# Altium project Main_Board.PrjPcb (part 17 of 44)
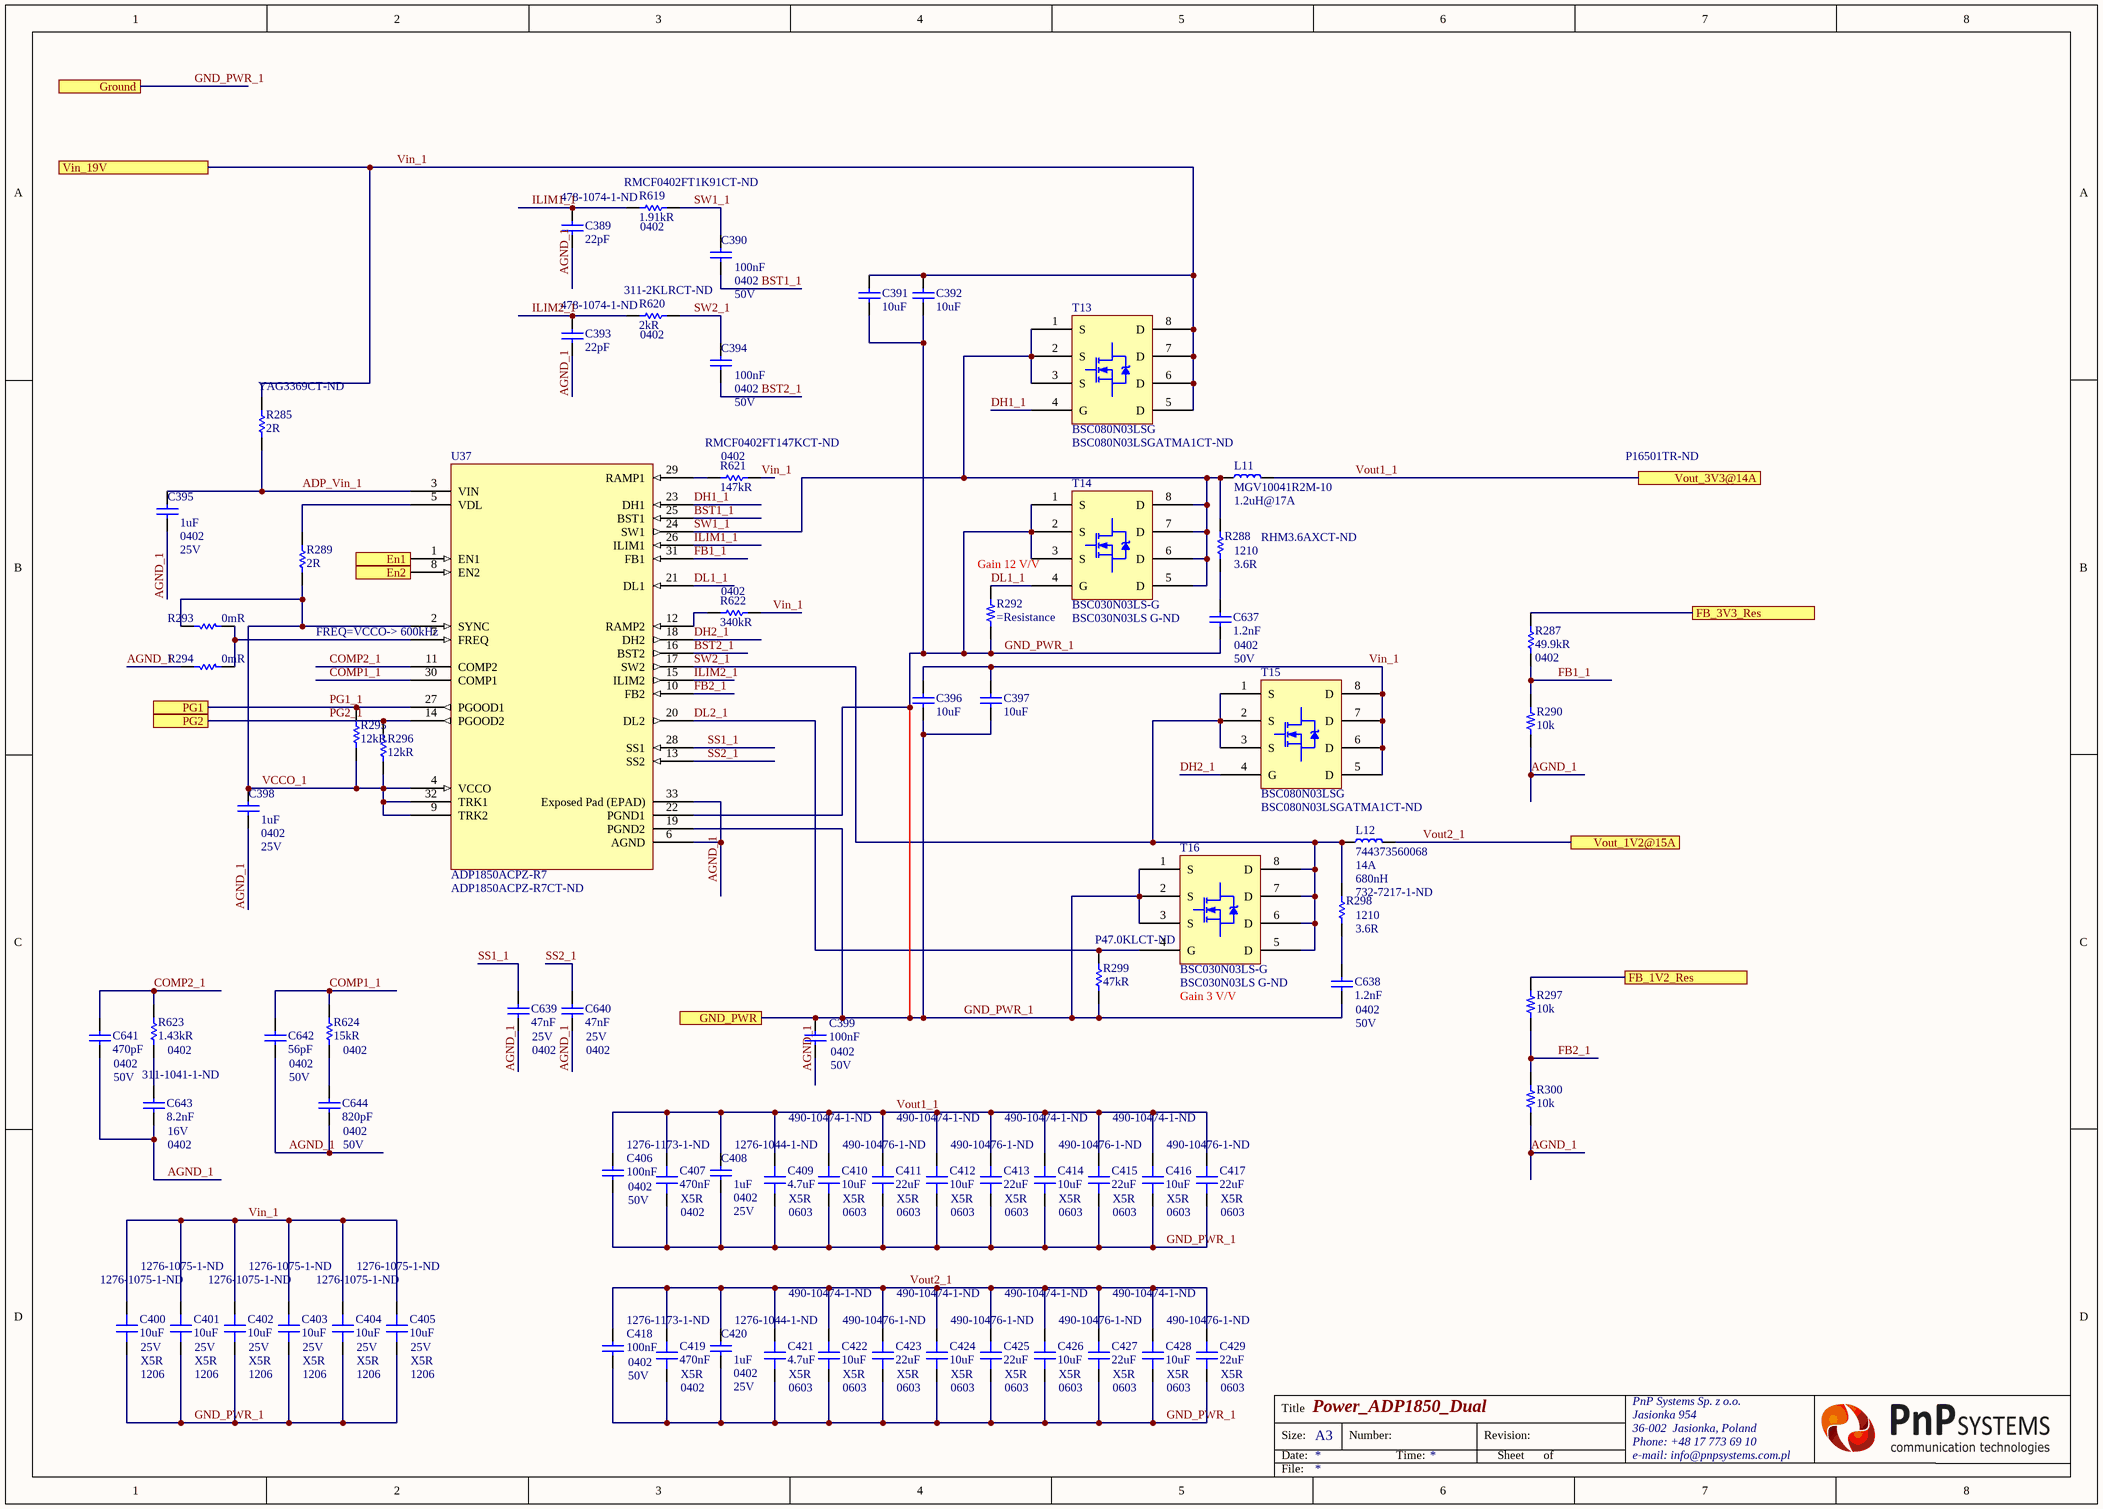
[diagram p128: Power_ADP1850_Dual.SchDoc]

## Sheet Power_ADP1850_Dual.SchDoc: Power_ADP1850_Dual (continued)
### Library data of the parts
C389 C393 = Capacitor: as C345 on sheet HI_Curr_ADP1850; Supplier 1: Digi-Key; Stock 1: 1489814; Pricing 1: 1 = 0,10000, 10 = 0,03500, 100 = 0,01550, 500 = 0,01108, 1000 = 0,00871, 2500 = 0,00792, 5000 = 0,00729 (USD); RoHS: Yes; Mount: Surface Mount; Case/Package: 0402; Number of Pins: 2; Case Code (Metric): 1005; Case Code (Imperial): 0402; Contact Plating: Tin,Matte; Min Operating Temperature: -55°C; Max Operating Temperature: 125°C; Capacitance: 22pF; Packaging: Tape and Reel; Voltage Rating (DC): 50V; Package Quantity: 1; Termination: SMD/SMT; Voltage: 50V; Length: 1mm; Height: 0.5mm; Width: 0.02inch; Depth: 0.5mm; Thickness: 0.022inch; Radiation Hardening: No; Lead Free: Lead Free; REACH SVHC: No SVHC; ComponentLink1URL: https://datasheet.ciiva.com/11787/0900766b80def0e2-11787300.pdf?src-supplier=RSComponents; ComponentLink1Description: https://datasheet.ciiva.com/11787/0900766b80def0e2-11787300.pdf?src-supplier=RSComponents; ComponentLink2URL: https://datasheet.ciiva.com/39121/2009578-39121644.pdf?src-supplier=Jameco; ComponentLink2Description: https://datasheet.ciiva.com/39121/2009578-39121644.pdf?src-supplier=Jameco; ComponentLink3URL: https://datasheet.ciiva.com/1123/ccog-1123585.pdf?src-supplier=Element14; ComponentLink3Description: https://datasheet.ciiva.com/1123/ccog-1123585.pdf?src-supplier=Element14; ComponentLink4URL: https://datasheet.ciiva.com/1123/ccog-1123586.pdf?src-supplier=Element14; ComponentLink4Description: https://datasheet.ciiva.com/1123/ccog-1123586.pdf?src-supplier=Element14; ComponentLink5URL: https://datasheet.ciiva.com/150/ccog-150515.pdf?src-supplier=Digi-Key; ComponentLink5Description: https://datasheet.ciiva.com/150/ccog-150515.pdf?src-supplier=Digi-Key; ComponentLink6URL: https://datasheet.ciiva.com/150/ccog-150516.pdf?src-supplier=Digi-Key; ComponentLink6Description: https://datasheet.ciiva.com/150/ccog-150516.pdf?src-supplier=Digi-Key; ComponentLink7URL: https://datasheet.ciiva.com/150/ccog-150517.pdf?src-supplier=Digi-Key; ComponentLink7Description: https://datasheet.ciiva.com/150/ccog-150517.pdf?src-supplier=Digi-Key; ComponentLink8URL: https://datasheet.ciiva.com/2987/ccog-2987653.pdf?src-supplier=Avnet; ComponentLink8Description: https://datasheet.ciiva.com/2987/ccog-2987653.pdf?src-supplier=Avnet; ComponentLink9URL: https://datasheet.ciiva.com/2987/ccog-2987654.pdf?src-supplier=Avnet; ComponentLink9Description: https://datasheet.ciiva.com/2987/ccog-2987654.pdf?src-supplier=Avnet; ComponentLink10URL: https://datasheet.ciiva.com/5423/ccog-243403-5423927.pdf?src-supplier=Mouser; ComponentLink10Description: https://datasheet.ciiva.com/5423/ccog-243403-5423927.pdf?src-supplier=Mouser; ComponentLink11URL: https://datasheet.ciiva.com/16218/ccog-16218185.pdf?src-supplier=Future+Electronics; ComponentLink11Description: https://datasheet.ciiva.com/16218/ccog-16218185.pdf?src-supplier=Future+Electronics; ComponentLink12URL: https://datasheet.ciiva.com/28592/759117-28592746.pdf?src-supplier=Element14; ComponentLink12Description: https://datasheet.ciiva.com/28592/759117-28592746.pdf?src-supplier=Element14; ComponentLink13URL: https://datasheet.ciiva.com/15165/getdatasheetpartid-38041-15165131.pdf?src-supplier=Verical; ComponentLink13Description: https://datasheet.ciiva.com/15165/getdatasheetpartid-38041-15165131.pdf?src-supplier=Verical
C390 C394 C399 C406 C418 = Capacitor: as C346 on sheet HI_Curr_ADP1850; Supplier 1: Digi-Key; Supplier Part Number 1: 490-10697-1-ND; RoHS: Yes; Category: Ceramic Capacitors; Stock 1: 435607; Pricing 1: 1=0,10000, 10=0,04600, 100=0,02050, 500=0,01464, 1000=0,01150, 2500=0,01045, 5000=0,00961 (USD); Mount: Surface Mount; Case/Package: 0402; Weight: 0.000212oz; Case Code (Metric): 1005; Min Operating Temperature: -55°C; Max Operating Temperature: 85°C; Capacitance: 100nF; Packaging: Tape and Reel; Voltage Rating: 50V; Dielectric: X5R; Termination: SMD/SMT; Composition: Ceramic; Voltage Rating (DC): 50V; Package Quantity: 10000; Length: 1mm; Height: 0.5mm; Width: 0.02inch; Thickness: 0.022inch; Depth: 0.5mm; REACH SVHC: No SVHC; Lead Free: Lead Free; ComponentLink1URL: http://www.farnell.com/datasheets/2079150.pdf?src-supplier=Farnell; ComponentLink1Description: http://www.farnell.com/datasheets/2079150.pdf?src-supplier=Farnell; ComponentLink2URL: http://www.mouser.com/ds/2/281/c02e-2905.pdf?src-supplier=Mouser; ComponentLink2Description: http://www.mouser.com/ds/2/281/c02e-2905.pdf?src-supplier=Mouser; ComponentLink3URL: http://www.farnell.com/datasheets/2079150.pdf?src-supplier=Element14; ComponentLink3Description: http://www.farnell.com/datasheets/2079150.pdf?src-supplier=Element14; ComponentLink4URL: http://search.murata.co.jp/Ceramy/image/img/A01X/G101/ENG/GRM155R61H104KE14-01.pdf?src-supplier=Digi-Key; ComponentLink4Description: http://search.murata.co.jp/Ceramy/image/img/A01X/G101/ENG/GRM155R61H104KE14-01.pdf?src-supplier=Digi-Key
C391 C392 C396 C397 = Capacitor: as C347 on sheet HI_Curr_ADP1850; Supplier 1: Digi-Key; Supplier Part Number 1: 490-6519-1-ND; Stock 1: 9864; Pricing 1: 1=0,79000, 10=0,59800, 100=0,42750, 500=0,33098, 1000=0,28501 (USD); RoHS: Yes; Mount: Surface Mount; Case/Package: 1206; Case Code (Metric): 3216; Case Code (Imperial): 1206; Min Operating Temperature: -55°C; Max Operating Temperature: 125°C; Capacitance: 10uF; Package Quantity: 1; Packaging: Tape and Reel; Termination: SMD/SMT; Voltage: 25V; Voltage Rating (DC): 25V; Length: 3.2mm; Height: 1.6mm; Width: 0.063inch; Thickness: 0.071inch; Depth: 1.6mm; Radiation Hardening: No; REACH SVHC: No SVHC; Lead Free: Lead Free; ComponentLink1URL: https://datasheet.ciiva.com/11607/product-11607561.pdf?src-supplier=Avnet; ComponentLink1Description: https://datasheet.ciiva.com/11607/product-11607561.pdf?src-supplier=Avnet; ComponentLink2URL: https://datasheet.ciiva.com/5412/product-5412861.pdf?src-supplier=Mouser; ComponentLink2Description: https://datasheet.ciiva.com/5412/product-5412861.pdf?src-supplier=Mouser; ComponentLink3URL: https://datasheet.ciiva.com/6264/partnumbering-e-01-6264463.pdf?src-supplier=Digi-Key; ComponentLink3Description: https://datasheet.ciiva.com/6264/partnumbering-e-01-6264463.pdf?src-supplier=Digi-Key
C395 C398 C408 C420 = Capacitor: as C331 on sheet Power_Hi_Curr; Supplier 1: Digi-Key; Supplier Part Number 1: 490-12263-1-ND; Manufacturer: Murata; Manufacturer Part Number: GRT155R61E105KE01D; RoHS: Yes; Category: Ceramic Capacitors; Stock 1: 341453; Pricing 1: 1=0,18000, 10=0,12300, 100=0,06210, 500=0,04248, 1000=0,03758, 2500=0,03594, 5000=0,03268 (USD); Mount: Surface Mount; Case Code (Metric): 1005; Case Code (Imperial): 0402; Min Operating Temperature: -55°C; Max Operating Temperature: 85°C; Packaging: Tape and Reel; Capacitance: 1uF; Tolerance: 10%; Dielectric: X5R; Voltage Rating (DC): 25V; Length: 0.039inch; Width: 0.02inch; Thickness: 0.022inch; Ratings: AEC-Q200; ComponentLink1URL: http://www.farnell.com/datasheets/2165918.pdf?src-supplier=Farnell; ComponentLink1Description: http://www.farnell.com/datasheets/2165918.pdf?src-supplier=Farnell; ComponentLink2URL: http://search.murata.co.jp/Ceramy/image/img/A01X/G101/ENG/GRT155R61E105KE01-01.pdf?src-supplier=Digi-Key; ComponentLink2Description: http://search.murata.co.jp/Ceramy/image/img/A01X/G101/ENG/GRT155R61E105KE01-01.pdf?src-supplier=Digi-Key; ComponentLink3URL: http://www.farnell.com/datasheets/2165918.pdf?src-supplier=Element14; ComponentLink3Description: http://www.farnell.com/datasheets/2165918.pdf?src-supplier=Element14
C400-C405 = Capacitor: as C371 on sheet HI_Curr_ADP1850; Supplier 1: Digi-Key; RoHS: Yes; Category: Ceramic Capacitors; Stock 1: 791813; Pricing 1: 1=0,22000, 10=0,15000, 100=0,07600, 500=0,05200, 1000=0,04600 (USD); Mount: Surface Mount; Case Code (Metric): 3216; Case Code (Imperial): 1206; Material: Ceramic; Contact Plating: Tin; Min Operating Temperature: -55°C; Max Operating Temperature: 85°C; Tolerance: 10%; Capacitance: 10uF; Voltage Rating (DC): 25V; Packaging: Tape and Reel; Voltage Rating: 25V; Length: 3.2mm; Height: 1.6mm; Depth: 1.6mm; Width: 0.063inch; Thickness: 0.071inch; Radiation Hardening: No; Lead Free: Lead Free; ComponentLink1URL: https://datasheet.ciiva.com/25710/cl31a106kahnnne-25710837.pdf?src-supplier=Digi-Key; ComponentLink1Description: https://datasheet.ciiva.com/25710/cl31a106kahnnne-25710837.pdf?src-supplier=Digi-Key; ComponentLink2URL: https://datasheet.ciiva.com/15195/getdatasheetpartid-355210-15195990.pdf?src-supplier=Verical; ComponentLink2Description: https://datasheet.ciiva.com/15195/getdatasheetpartid-355210-15195990.pdf?src-supplier=Verical; ComponentLink3URL: https://datasheet.ciiva.com/29201/452519-da-01-en-vs-kondensator-1206-29201124.pdf?src-supplier=Conrad; ComponentLink3Description: https://datasheet.ciiva.com/29201/452519-da-01-en-vs-kondensator-1206-29201124.pdf?src-supplier=Conrad
C407 C419 = Capacitor: as C360 on sheet HI_Curr_ADP1850; Supplier 1: Digi-Key; Stock 1: 941442; Pricing 1: 1 = 0,10000, 10 = 0,07000, 100 = 0,03140, 500 = 0,02240, 1000 = 0,01761, 2500 = 0,01600, 5000 = 0,01472 (USD); RoHS: Yes; Mount: Surface Mount; Case Code (Metric): 1005; Case Code (Imperial): 0402; Min Operating Temperature: -55°C; Max Operating Temperature: 85°C; Capacitance: 470nF; Packaging: Tape and Reel; Voltage Rating (DC): 10V; Length: 1mm; Height: 0.5mm; Width: 0.02inch; Thickness: 0.022inch; Depth: 0.5mm; Radiation Hardening: No; Lead Free: Lead Free; ComponentLink1URL: https://datasheet.ciiva.com/25710/cl05a474kp5nnnc-25710324.pdf?src-supplier=Digi-Key; ComponentLink1Description: https://datasheet.ciiva.com/25710/cl05a474kp5nnnc-25710324.pdf?src-supplier=Digi-Key; ComponentLink2URL: https://datasheet.ciiva.com/26838/getdatasheetpartid-355286-26838191.pdf?src-supplier=Verical; ComponentLink2Description: https://datasheet.ciiva.com/26838/getdatasheetpartid-355286-26838191.pdf?src-supplier=Verical; ComponentLink3URL: https://datasheet.ciiva.com/16437/cl05b104kq5nnnc-16437351.pdf?src-supplier=Future+Electronics; ComponentLink3Description: https://datasheet.ciiva.com/16437/cl05b104kq5nnnc-16437351.pdf?src-supplier=Future+Electronics
C409 C421 = Capacitor: as C362 on sheet HI_Curr_ADP1850; Supplier 1: Digi-Key; Stock 1: 2124648; Pricing 1: 1 = 0,13000, 10 = 0,09600, 100 = 0,04520, 500 = 0,03168, 1000 = 0,02622 (USD); RoHS: Yes; Mount: Surface Mount; Case Code (Metric): 1608; Case Code (Imperial): 0603; Contact Plating: Tin; Min Operating Temperature: -55°C; Max Operating Temperature: 85°C; Capacitance: 4.7uF; Package Quantity: 1; Packaging: Tape and Reel; Length: 1.6mm; Height: 0.8mm; Width: 0.031inch; Thickness: 0.035inch; Depth: 0.8mm; Radiation Hardening: No; ComponentLink1URL: https://datasheet.ciiva.com/25797/cl10a475kp8nnnc-25797520.pdf?src-supplier=Digi-Key; ComponentLink1Description: https://datasheet.ciiva.com/25797/cl10a475kp8nnnc-25797520.pdf?src-supplier=Digi-Key; ComponentLink2URL: https://datasheet.ciiva.com/26838/getdatasheetpartid-358676-26838384.pdf?src-supplier=Verical; ComponentLink2Description: https://datasheet.ciiva.com/26838/getdatasheetpartid-358676-26838384.pdf?src-supplier=Verical; ComponentLink3URL: https://datasheet.ciiva.com/16318/cl05b104kq5nnnc-16318245.pdf?src-supplier=Future+Electronics; ComponentLink3Description: https://datasheet.ciiva.com/16318/cl05b104kq5nnnc-16318245.pdf?src-supplier=Future+Electronics
C410 C412 C414 C416 C422 C424 C426 C428 = Capacitor: as C363 on sheet HI_Curr_ADP1850; Supplier 1: Digi-Key; Stock 1: 4597169; Pricing 1: 1 = 0,21000, 10 = 0,14000, 100 = 0,07110, 500 = 0,04864, 1000 = 0,04303 (USD); RoHS: Yes; Mount: Surface Mount; Case Code (Metric): 1608; Case Code (Imperial): 0603; Min Operating Temperature: -55°C; Max Operating Temperature: 85°C; Capacitance: 10uF; Packaging: Tape and Reel; Voltage: 10V; Voltage Rating (DC): 10V; Length: 1.6mm; Height: 0.8mm; Width: 0.031inch; Thickness: 0.037inch; Depth: 0.8mm; REACH SVHC: No SVHC; Lead Free: Lead Free; ComponentLink1URL: http://components.arrow.com/part/dataview/0323_07281717?src-supplier=Arrow+Europe; ComponentLink1Description: http://components.arrow.com/part/dataview/0323_07281717?src-supplier=Arrow+Europe; ComponentLink2URL: http://www.farnell.com/datasheets/1955682.pdf?src-supplier=Farnell; ComponentLink2Description: http://www.farnell.com/datasheets/1955682.pdf?src-supplier=Farnell; ComponentLink3URL: http://www.mouser.com/ds/2/281/c02e-2905.pdf?src-supplier=Mouser; ComponentLink3Description: http://www.mouser.com/ds/2/281/c02e-2905.pdf?src-supplier=Mouser; ComponentLink4URL: http://search.murata.co.jp/Ceramy/image/img/A01X/G101/ENG/GRM188R61A106KE69-01.pdf?src-supplier=Digi-Key; ComponentLink4Description: http://search.murata.co.jp/Ceramy/image/img/A01X/G101/ENG/GRM188R61A106KE69-01.pdf?src-supplier=Digi-Key; ComponentLink5URL: http://www.farnell.com/datasheets/1955682.pdf?src-supplier=Element14; ComponentLink5Description: http://www.farnell.com/datasheets/1955682.pdf?src-supplier=Element14; ComponentLink6URL: http://www.farnell.com/datasheets/1955682.pdf?src-supplier=Newark; ComponentLink6Description: http://www.farnell.com/datasheets/1955682.pdf?src-supplier=Newark; ComponentLink7URL: http://psearch.en.murata.com/capacitor/product/GRM188R61A106KE69%23.pdf?src-supplier=Avnet; ComponentLink7Description: http://psearch.en.murata.com/capacitor/product/GRM188R61A106KE69%23.pdf?src-supplier=Avnet
C411 C413 C415 C417 C423 C425 C427 C429 = Capacitor: as C364 on sheet HI_Curr_ADP1850; Supplier 1: Digi-Key; Stock 1: 1768748; Pricing 1: 1 = 0,31000, 10 = 0,21500, 100 = 0,12160, 500 = 0,08584, 1000 = 0,07512 (USD); RoHS: Yes; Mount: Surface Mount; Weight: 0.000222oz; Case Code (Metric): 1608; Case Code (Imperial): 0603; Min Operating Temperature: -55°C; Max Operating Temperature: 85°C; Capacitance: 22uF; Packaging: Tape and Reel; Termination: SMD/SMT; Voltage Rating (DC): 10V; Package Quantity: 4000; Length: 1.6mm; Height: 0.8mm; Width: 0.8mm; Thickness: 0.039inch; Depth: 0.8mm; REACH SVHC: No SVHC; Lead Free: Lead Free; ComponentLink1URL: https://datasheet.ciiva.com/46444/1769893-46444975.pdf?src-supplier=Element14; ComponentLink1Description: https://datasheet.ciiva.com/46444/1769893-46444975.pdf?src-supplier=Element14
C637 C638 = Capacitor: CAP CER 1200PF 50V X7R 0402; Manufacturer: Yageo; Manufacturer Part Number: CC0402KRX7R9BB122; Tolerance: 10%; Supplier 1: Digi-Key; Supplier Part Number 1: 311-1031-1-ND; RoHS: Yes; Category: Ceramic Capacitors; Stock 1: 202147; Pricing 1: 1=0,10000, 10=0,03100, 100=0,01370, 500=0,00982, 1000=0,00771, 2500=0,00701, 5000=0,00645 (USD); Mount: Surface Mount; Number of Pins: 2; Weight: 2.3E-05oz; Case Code (Metric): 1005; Case Code (Imperial): 0402; Min Operating Temperature: -55°C; Max Operating Temperature: 125°C; Capacitance: 1.2nF; Voltage Rating: 50V; Packaging: Tape and Reel; Package Quantity: 1; Dielectric: X7R; Termination: SMD/SMT; Composition: Ceramic; Length: 1mm; Height: 0.5mm; Width: 0.02inch; Thickness: 0.022inch; Depth: 0.5mm; Radiation Hardening: No; Lead Free: Lead Free; Halogen Free: Halogen Free; ComponentLink1URL: https://datasheet.ciiva.com/26862/getdatasheetpartid-403475-26862644.pdf?src-supplier=Verical; ComponentLink1Description: https://datasheet.ciiva.com/26862/getdatasheetpartid-403475-26862644.pdf?src-supplier=Verical; ComponentLink2URL: https://datasheet.ciiva.com/143/mlccorderingcode-143979.pdf?src-supplier=Digi-Key; ComponentLink2Description: https://datasheet.ciiva.com/143/mlccorderingcode-143979.pdf?src-supplier=Digi-Key; ComponentLink3URL: https://datasheet.ciiva.com/143/mlccorderingcode-143977.pdf?src-supplier=Digi-Key; ComponentLink3Description: https://datasheet.ciiva.com/143/mlccorderingcode-143977.pdf?src-supplier=Digi-Key; ComponentLink4URL: https://datasheet.ciiva.com/13209/upy-gphc-x7r-6-3v-to-50v-8-12304-13209337.pdf?src-supplier=Mouser; ComponentLink4Description: https://datasheet.ciiva.com/13209/upy-gphc-x7r-6-3v-to-50v-8-12304-13209337.pdf?src-supplier=Mouser; ComponentLink5URL: https://datasheet.ciiva.com/17437/upy-gphc-x7r-6-3v-to-50v-8-17437177.pdf?src-supplier=Avnet+Europe; ComponentLink5Description: https://datasheet.ciiva.com/17437/upy-gphc-x7r-6-3v-to-50v-8-17437177.pdf?src-supplier=Avnet+Europe; ComponentLink6URL: https://datasheet.ciiva.com/143/mlccorderingcode-143978.pdf?src-supplier=Digi-Key; ComponentLink6Description: https://datasheet.ciiva.com/143/mlccorderingcode-143978.pdf?src-supplier=Digi-Key
C639 C640 = Capacitor: Manufacturer: Yageo; Manufacturer Part Number: CC0402KRX7R8BB473; Tolerance: 10%; Dielectric: X7R; Dissipation Factor: 3.5%; Insulation Resistance: 10GR; Supplier 1: Digi-Key; Supplier Part Number 1: 311-1717-1-ND; Stock 1: 136338; Pricing 1: 1 = 0,10000, 10 = 0,03800, 100 = 0,01710, 500 = 0,01224, 1000 = 0,00962, 2500 = 0,00874, 5000 = 0,00805 (USD); RoHS: Yes; Mount: Surface Mount; Case/Package: 0402; Weight: 2.3E-05oz; Case Code (Metric): 1005; Min Operating Temperature: -55°C; Max Operating Temperature: 125°C; Voltage Rating (DC): 25V; Packaging: Tape and Reel; Capacitance: 47nF; Termination: SMD/SMT; Composition: Ceramic; Length: 0.039inch; Width: 0.02inch; Thickness: 0.022inch; Depth: 0.5mm; Lead Free: Lead Free; Halogen Free: Halogen Free; ComponentLink1URL: http://www.mouser.com/ds/2/447/Yageo_UPY-GP_NP0_16V-to-50V_9-358835.pdf?src-supplier=Mouser; ComponentLink1Description: http://www.mouser.com/ds/2/447/Yageo_UPY-GP_NP0_16V-to-50V_9-358835.pdf?src-supplier=Mouser; ComponentLink2URL: http://components.arrow.com/part/dataview/0323_02822063?src-supplier=Arrow+Europe; ComponentLink2Description: http://components.arrow.com/part/dataview/0323_02822063?src-supplier=Arrow+Europe; ComponentLink3URL: http://www.yageo.com/documents/recent/UPY-GPHC_X7R_6.3V-to-50V_18.pdf?src-supplier=Digi-Key; ComponentLink3Description: http://www.yageo.com/documents/recent/UPY-GPHC_X7R_6.3V-to-50V_18.pdf?src-supplier=Digi-Key; ComponentLink4URL: http://www.yageo.com/exep/pages/download/literatures/ProductSelectionGuide%202014_Final_2.pdf?src-supplier=Digi-Key; ComponentLink4Description: http://www.yageo.com/exep/pages/download/literatures/ProductSelectionGuide%202014_Final_2.pdf?src-supplier=Digi-Key; ComponentLink5URL: http://www.yageo.com/documents/recent/UPY-GPHC_X7R_6.3V-to-50V_10.pdf?src-supplier=Future+Electronics; ComponentLink5Description: http://www.yageo.com/documents/recent/UPY-GPHC_X7R_6.3V-to-50V_10.pdf?src-supplier=Future+Electronics
C641 = Capacitor: Manufacturer: KEMET; Manufacturer Part Number: C0402C471K5RACTU; Dielectric Material: Ceramic; Tolerance: 10%; Dielectric: X7R; Supplier 1: Digi-Key; Supplier Part Number 1: 399-1025-1-ND; Stock 1: 1606299; Pricing 1: 1 = 0,10000, 10 = 0,03300, 100 = 0,01490, 500 = 0,01062, 1000 = 0,00835, 2500 = 0,00759, 5000 = 0,00698 (USD); RoHS: Yes; Mount: Surface Mount; Contact Plating: Tin,Matte; Min Operating Temperature: -55°C; Max Operating Temperature: 125°C; Capacitance: 470pF; Packaging: Tape and Reel; Termination: SMD/SMT; Voltage Rating (DC): 50V; Length: 1mm; Height: 0.5mm; Depth: 0.5mm; Radiation Hardening: No; ComponentLink1URL: https://datasheet.ciiva.com/7747/kem-c1002-x7r-smd-7747647.pdf?src-supplier=Element14; ComponentLink1Description: https://datasheet.ciiva.com/7747/kem-c1002-x7r-smd-7747647.pdf?src-supplier=Element14; ComponentLink2URL: https://datasheet.ciiva.com/6126/kem-c1002-x7r-smd-6126681.pdf?src-supplier=Farnell; ComponentLink2Description: https://datasheet.ciiva.com/6126/kem-c1002-x7r-smd-6126681.pdf?src-supplier=Farnell
C642 = Capacitor: Manufacturer: Yageo; Manufacturer Part Number: CC0402JRNPO9BN560; Tolerance: 5%; Dielectric: C0G; Supplier 1: Digi-Key; Supplier Part Number 1: 311-1022-1-ND; Stock 1: 531196; Pricing 1: 1 = 0,10000, 10 = 0,02300, 100 = 0,01030, 500 = 0,00736, 1000 = 0,00578, 2500 = 0,00525, 5000 = 0,00483 (USD); RoHS: Yes; Mount: Surface Mount; Case/Package: 0402; Number of Pins: 2; Weight: 2.3E-05oz; Case Code (Metric): 1005; Min Operating Temperature: -55°C; Max Operating Temperature: 125°C; Capacitance: 56pF; Packaging: Tape and Reel; Package Quantity: 1; Voltage Rating (DC): 50V; Termination: SMD/SMT; Composition: Ceramic; Length: 1mm; Height: 0.5mm; Width: 0.02inch; Thickness: 0.022inch; Depth: 0.5mm; Radiation Hardening: No; REACH SVHC: No SVHC; Lead Free: Lead Free; ComponentLink1URL: https://datasheet.ciiva.com/144/mlccorderingcode-144004.pdf?src-supplier=Digi-Key; ComponentLink1Description: https://datasheet.ciiva.com/144/mlccorderingcode-144004.pdf?src-supplier=Digi-Key; ComponentLink2URL: https://datasheet.ciiva.com/144/mlccorderingcode-144005.pdf?src-supplier=Digi-Key; ComponentLink2Description: https://datasheet.ciiva.com/144/mlccorderingcode-144005.pdf?src-supplier=Digi-Key; ComponentLink3URL: https://datasheet.ciiva.com/11587/upy-gp-np0-16v-to-50v-8-11587093.pdf?src-supplier=Avnet; ComponentLink3Description: https://datasheet.ciiva.com/11587/upy-gp-np0-16v-to-50v-8-11587093.pdf?src-supplier=Avnet; ComponentLink4URL: https://datasheet.ciiva.com/144/mlccorderingcode-144006.pdf?src-supplier=Digi-Key; ComponentLink4Description: https://datasheet.ciiva.com/144/mlccorderingcode-144006.pdf?src-supplier=Digi-Key; ComponentLink5URL: https://datasheet.ciiva.com/13208/upy-gp-np0-16v-to-50v-8-13208374.pdf?src-supplier=Mouser; ComponentLink5Description: https://datasheet.ciiva.com/13208/upy-gp-np0-16v-to-50v-8-13208374.pdf?src-supplier=Mouser; ComponentLink6URL: https://datasheet.ciiva.com/26862/getdatasheetpartid-403455-26862602.pdf?src-supplier=Verical; ComponentLink6Description: https://datasheet.ciiva.com/26862/getdatasheetpartid-403455-26862602.pdf?src-supplier=Verical; ComponentLink7URL: https://datasheet.ciiva.com/28450/1443161-28450271.pdf?src-supplier=Element14; ComponentLink7Description: https://datasheet.ciiva.com/28450/1443161-28450271.pdf?src-supplier=Element14
C643 = Capacitor: Manufacturer: Yageo; Manufacturer Part Number: CC0402KRX7R7BB822; Tolerance: 10%; Dielectric: X7R; Supplier 1: Digi-Key; Stock 1: 137774; Pricing 1: 1 = 0,10000, 10 = 0,02500, 100 = 0,01090, 500 = 0,00782, 1000 = 0,00614, 2500 = 0,00558, 5000 = 0,00514 (USD); RoHS: Yes; Mount: Surface Mount; Case/Package: 0402; Case Code (Metric): 1005; Min Operating Temperature: -55°C; Max Operating Temperature: 125°C; Capacitance: 8.2nF; Packaging: Tape and Reel; Package Quantity: 1; Termination: SMD/SMT; Voltage Rating (DC): 16V; Length: 1mm; Height: 0.5mm; Width: 0.02inch; Thickness: 0.022inch; Depth: 0.5mm; Radiation Hardening: No; Lead Free: Lead Free; Halogen Free: Halogen Free; ComponentLink1URL: https://datasheet.ciiva.com/26862/getdatasheetpartid-407631-26862637.pdf?src-supplier=Verical; ComponentLink1Description: https://datasheet.ciiva.com/26862/getdatasheetpartid-407631-26862637.pdf?src-supplier=Verical; ComponentLink2URL: https://datasheet.ciiva.com/155/mlccorderingcode-155857.pdf?src-supplier=Digi-Key; ComponentLink2Description: https://datasheet.ciiva.com/155/mlccorderingcode-155857.pdf?src-supplier=Digi-Key; ComponentLink3URL: https://datasheet.ciiva.com/17437/upy-gphc-x7r-6-3v-to-50v-8-17437354.pdf?src-supplier=Avnet+Europe; ComponentLink3Description: https://datasheet.ciiva.com/17437/upy-gphc-x7r-6-3v-to-50v-8-17437354.pdf?src-supplier=Avnet+Europe; ComponentLink4URL: https://datasheet.ciiva.com/11464/upy-gphc-x7r-6-3v-to-50v-8-11464887.pdf?src-supplier=Avnet; ComponentLink4Description: https://datasheet.ciiva.com/11464/upy-gphc-x7r-6-3v-to-50v-8-11464887.pdf?src-supplier=Avnet; ComponentLink5URL: https://datasheet.ciiva.com/155/mlccorderingcode-155858.pdf?src-supplier=Digi-Key; ComponentLink5Description: https://datasheet.ciiva.com/155/mlccorderingcode-155858.pdf?src-supplier=Digi-Key; ComponentLink6URL: https://datasheet.ciiva.com/155/mlccorderingcode-155859.pdf?src-supplier=Digi-Key; ComponentLink6Description: https://datasheet.ciiva.com/155/mlccorderingcode-155859.pdf?src-supplier=Digi-Key
C644 = Capacitor: Manufacturer: Yageo; Manufacturer Part Number: CC0402KRX7R9BB821; Tolerance: 10%; Dielectric: X7R; Supplier 1: Digi-Key; Supplier Part Number 1: 311-1727-1-ND; Stock 1: 31098; Pricing 1: 1 = 0,10000, 10 = 0,03600, 100 = 0,01620, 500 = 0,01156, 1000 = 0,00908, 2500 = 0,00825, 5000 = 0,00759 (USD); RoHS: Yes; Mount: Surface Mount; Case/Package: 0402; Number of Pins: 2; Case Code (Metric): 1005; Min Operating Temperature: -55°C; Max Operating Temperature: 125°C; Capacitance: 820pF; Voltage Rating: 50V; Package Quantity: 10000; Voltage Rating (DC): 50V; Packaging: Tape and Reel; Termination: SMD/SMT; Composition: Ceramic; Length: 1mm; Height: 0.5mm; Width: 0.02inch; Thickness: 0.022inch; Depth: 0.5mm; Radiation Hardening: No; Lead Free: Lead Free; Halogen Free: Halogen Free; ComponentLink1URL: https://datasheet.ciiva.com/11786/0900766b80d84f1d-11786151.pdf?src-supplier=RSComponents; ComponentLink1Description: https://datasheet.ciiva.com/11786/0900766b80d84f1d-11786151.pdf?src-supplier=RSComponents; ComponentLink2URL: https://datasheet.ciiva.com/26862/getdatasheetpartid-495580-26862654.pdf?src-supplier=Verical; ComponentLink2Description: https://datasheet.ciiva.com/26862/getdatasheetpartid-495580-26862654.pdf?src-supplier=Verical; ComponentLink3URL: https://datasheet.ciiva.com/11587/upy-gphc-x7r-6-3v-to-50v-8-11587306.pdf?src-supplier=Avnet; ComponentLink3Description: https://datasheet.ciiva.com/11587/upy-gphc-x7r-6-3v-to-50v-8-11587306.pdf?src-supplier=Avnet; ComponentLink4URL: https://datasheet.ciiva.com/13210/upy-gphc-x7r-6-3v-to-50v-8-12304-13210429.pdf?src-supplier=Mouser; ComponentLink4Description: https://datasheet.ciiva.com/13210/upy-gphc-x7r-6-3v-to-50v-8-12304-13210429.pdf?src-supplier=Mouser; ComponentLink5URL: https://datasheet.ciiva.com/16623/upy-gphc-x7r-6-3v-to-50v-8-16623934.pdf?src-supplier=Avnet+Europe; ComponentLink5Description: https://datasheet.ciiva.com/16623/upy-gphc-x7r-6-3v-to-50v-8-16623934.pdf?src-supplier=Avnet+Europe
L11 = MGV10041R2M-10: 1.2µH Shielded Molded Inductor 17A 3.8mOhm Max Nonstandard; Manufacturer 1: Laird; Supplier 1: Digi-Key; Manufacturer Part Number 1: MGV10041R2M-10; Stock 1: 1781; Pricing 1: 1=1,46000, 10=1,35700, 100=0,98140 (USD); RoHS: No; ComponentLink1Description: MGV1004 Series; ComponentLink1URL: https://assets.lairdtech.com/home/brandworld/files/MGV1004%20series%20approve%20sheet.pdf; Supplier Part Number 1: 240-3187-1-ND
L12 = 744373560068: Wurth WE-LHMI Series Shielded Wire-wound SMD Inductor with a Iron Core, 0.68 µH Moulded 14A Idc; Manufacturer 1: Wurth Electronics; Core Material: Ferrite; Saturation Current: 32.5A; DC Resistance (DCR): 3.99mR; Self Resonant Frequency: 53MHz; Test Frequency: 100kHz; Tolerance: 20%; Supplier 1: Digi-Key; Manufacturer Part Number 1: 744373560068; Stock 1: 995; Pricing 1: 1=2,08000, 10=1,92800, 50=1,75300, 100=1,59400, 500=1,44900 (USD); RoHS: Yes; Mount: Surface Mount; Case/Package: Nonstandard; Min Operating Temperature: -40°C; Max Operating Temperature: 125°C; Packaging: Tape and Reel; Composition: Wirewound; Shielding: Shielded; Length: 0.362inch; Width: 0.335inch; Height - Seated (Max): 0.118inch; ComponentLink1Description: Datasheet; ComponentLink1URL: https://www.we-online.de/katalog/datasheet/744373560068.pdf
R285 R289 = Resistor: as R268 on sheet HI_Curr_ADP1850; Supplier 1: Digi-Key; Stock 1: 417064; Pricing 1: 1=0,10000, 10=0,02400, 100=0,00970, 1000=0,00435, 2500=0,00377, 5000=0,00312 (USD); RoHS: Yes; Case/Package: 0402; Case Code (Imperial): 0402; Case Code (Metric): 1005; Contact Plating: Tin,Matte; Min Operating Temperature: -55°C; Max Operating Temperature: 155°C; Resistance: 2R; Packaging: Tape and Reel; Composition: Thick Film; Termination: SMD/SMT; Number of Terminations: 2; Military Standard: Not; Max Power Dissipation: 63mW; Voltage Rating (DC): 50V; Features: Moisture Resistant; Length: 1mm; Height: 0.016inch; Width: 0.02inch; Depth: 0.5mm; REACH SVHC: Unknown; Lead Free: Lead Free; ComponentLink1URL: https://datasheet.ciiva.com/11808/0900766b80c66297-11808785.pdf?src-supplier=RSComponents; ComponentLink1Description: https://datasheet.ciiva.com/11808/0900766b80c66297-11808785.pdf?src-supplier=RSComponents; ComponentLink2URL: https://datasheet.ciiva.com/16868/pyu-rc0402-51-rohs-l-6-16868438.pdf?src-supplier=Avnet+Europe; ComponentLink2Description: https://datasheet.ciiva.com/16868/pyu-rc0402-51-rohs-l-6-16868438.pdf?src-supplier=Avnet+Europe; ComponentLink3URL: https://datasheet.ciiva.com/5596/pyu-rc0402-51-rohs-l-6-r-5596055.pdf?src-supplier=Mouser; ComponentLink3Description: https://datasheet.ciiva.com/5596/pyu-rc0402-51-rohs-l-6-r-5596055.pdf?src-supplier=Mouser; ComponentLink4URL: https://datasheet.ciiva.com/28415/pyu-rc0402-51-rohs-l-6-28415608.pdf?src-supplier=Avnet+Europe; ComponentLink4Description: https://datasheet.ciiva.com/28415/pyu-rc0402-51-rohs-l-6-28415608.pdf?src-supplier=Avnet+Europe; ComponentLink5URL: https://datasheet.ciiva.com/8894/pyu-rc0402-51-rohs-l-6-8894730.pdf?src-supplier=Avnet; ComponentLink5Description: https://datasheet.ciiva.com/8894/pyu-rc0402-51-rohs-l-6-8894730.pdf?src-supplier=Avnet; ComponentLink6URL: https://datasheet.ciiva.com/7849/1018594-7849950.pdf?src-supplier=Element14; ComponentLink6Description: https://datasheet.ciiva.com/7849/1018594-7849950.pdf?src-supplier=Element14; ComponentLink7URL: https://datasheet.ciiva.com/7849/1018594-7849951.pdf?src-supplier=Element14; ComponentLink7Description: https://datasheet.ciiva.com/7849/1018594-7849951.pdf?src-supplier=Element14
  R289: Supplier Part Number 1: YAG3369CT-ND
R287 = Resistor: Res Thin Film 0402 49.9K Ohm 0.1% 1/16W 25ppm/C Molded SMD SMD Punched Carrier T/R; Manufacturer: Panasonic; Manufacturer Part Number: ERA-2AEB4992X; Power Rating: 62.5mW; Temperature Coefficient: 25ppm/°C; Voltage Rating: 50V; Max Power Dissipation: 63mW; Supplier 1: Digi-Key; Supplier Part Number 1: P49.9KDCCT-ND; RoHS: Yes; Category: Chip SMD Resistors; Stock 1: 70823; Pricing 1: 1=0,43000, 10=0,30500, 100=0,12220, 1000=0,06021, 2500=0,05579, 5000=0,05047 (USD); Mount: Surface Mount; Case Code (Metric): 1005; Case Code (Imperial): 0402; Contact Plating: Tin; Min Operating Temperature: -55°C; Max Operating Temperature: 155°C; Resistance: 49.9kR; Packaging: Tape and Reel; Tolerance: 0.1%; Package Quantity: 1; Composition: Thin Film; Number of Terminations: 2; Voltage Rating (DC): 50V; Features: Automotive AEC-Q200; Military Standard: Not; Length: 1mm; Height: 0.016inch; Width: 0.02inch; Depth: 0.5mm; REACH SVHC: Unknown; Lead Free: Lead Free; ComponentLink1URL: https://datasheet.ciiva.com/9189/aoa0000ce26-9189149.pdf?src-supplier=Avnet; ComponentLink1Description: https://datasheet.ciiva.com/9189/aoa0000ce26-9189149.pdf?src-supplier=Avnet
R288 R298 = Resistor_1210: RES SMD 3.6 OHM 5% 1/2W 1210; Manufacturer: Rohm; Manufacturer Part Number: ESR25JZPJ3R6; Max Power Dissipation: 500mW; Temperature Coefficient: 200ppm/°C; Power: =Power (Watts); Supplier 1: Digi-Key; RoHS: Yes; Category: Chip SMD Resistors; Stock 1: 3497; Pricing 1: 1=0,36000, 10=0,30300, 100=0,11830, 1000=0,04950 (USD); Case Code (Metric): 3225; Case Code (Imperial): 1210; Min Operating Temperature: -55°C; Max Operating Temperature: 155°C; Package Quantity: 4000; Packaging: Cut Tape; Resistance: 3.6R; Tolerance: 5%; Composition: Thick Film; Number of Terminations: 2; Features: Automotive AEC-Q200; Length: 0.126inch; Height: 0.026inch; Width: 0.098inch; ComponentLink1URL: https://datasheet.ciiva.com/14928/esr-14928566.pdf?src-supplier=Digi-Key; ComponentLink1Description: https://datasheet.ciiva.com/14928/esr-14928566.pdf?src-supplier=Digi-Key; ComponentLink2URL: https://datasheet.ciiva.com/14932/esr-14932183.pdf?src-supplier=Digi-Key; ComponentLink2Description: https://datasheet.ciiva.com/14932/esr-14932183.pdf?src-supplier=Digi-Key
  R298: Supplier Part Number 1: RHM3.6AXCT-ND
R290 R297 R300 = Resistor: SMT Resistor; Value: 10k; Part Number: *; Supplier 1: Digi-Key; Supplier Part Number 1: RR05P10.0KDCT-ND
R292 = Resistor
R293 R294 = Resistor: Manufacturer 1: Yageo; Manufacturer Part Number 1: RC0402JR-070RL; Power Rating: 62.5mW; Tolerance: 5%; Voltage Rating: 50V; Max Power Dissipation: 63mW; Temperature Coefficient: 200ppm/°C; Supplier 1: Digi-Key; Supplier Part Number 1: 311-0.0JRCT-ND; Stock 1: 69822252; Pricing 1: 1=0.10000, 10=0.01200, 25=0.00920, 50=0.00680, 100=0.00510, 250=0.00388, 500=0.00308, 1000=0.00227, 5000=0.00163 (USD); RoHS: Yes; Case/Package: 0402; Contact Plating: Tin,Matte; Case Code (Metric): 1005; Case Code (Imperial): 0402; Min Operating Temperature: -55°C; Max Operating Temperature: 155°C; Resistance: 0mR; Packaging: Tape and Reel; Composition: Thick Film; Package Quantity: 1; Number of Terminations: 2; Termination: SMD/SMT; Military Standard: Not; Features: Moisture Resistant; Length: 1mm; Height: 0.016inch; Width: 0.02inch; Depth: 0.5mm; Radiation Hardening: No; REACH SVHC: Unknown; Lead Free: Lead Free; ComponentLink1URL: https://datasheet.ciiva.com/2452/pyu-rc0402-51-rohs-l-6-2452608.pdf?src-supplier=Digi-Key; ComponentLink1Description: https://datasheet.ciiva.com/2452/pyu-rc0402-51-rohs-l-6-2452608.pdf?src-supplier=Digi-Key; ComponentLink2URL: https://datasheet.ciiva.com/11808/0900766b80c66297-11808195.pdf?src-supplier=RSComponents; ComponentLink2Description: https://datasheet.ciiva.com/11808/0900766b80c66297-11808195.pdf?src-supplier=RSComponents; ComponentLink3URL: https://datasheet.ciiva.com/2452/pyu-r-int-thick-7-2452609.pdf?src-supplier=Digi-Key; ComponentLink3Description: https://datasheet.ciiva.com/2452/pyu-r-int-thick-7-2452609.pdf?src-supplier=Digi-Key; ComponentLink4URL: https://datasheet.ciiva.com/22747/1018594-22747515.pdf?src-supplier=Element14; ComponentLink4Description: https://datasheet.ciiva.com/22747/1018594-22747515.pdf?src-supplier=Element14; ComponentLink5URL: https://datasheet.ciiva.com/7983/1018594-7983535.pdf?src-supplier=Element14; ComponentLink5Description: https://datasheet.ciiva.com/7983/1018594-7983535.pdf?src-supplier=Element14; ComponentLink6URL: https://datasheet.ciiva.com/2452/pyu-r-int-thick-7-2452610.pdf?src-supplier=Digi-Key; ComponentLink6Description: https://datasheet.ciiva.com/2452/pyu-r-int-thick-7-2452610.pdf?src-supplier=Digi-Key; ComponentLink7URL: https://datasheet.ciiva.com/8896/pyu-rc0402-51-rohs-l-6-8896201.pdf?src-supplier=Avnet; ComponentLink7Description: https://datasheet.ciiva.com/8896/pyu-rc0402-51-rohs-l-6-8896201.pdf?src-supplier=Avnet; ComponentLink8URL: https://datasheet.ciiva.com/28386/pyu-rc0402-51-rohs-l-6-28386633.pdf?src-supplier=Avnet+Europe; ComponentLink8Description: https://datasheet.ciiva.com/28386/pyu-rc0402-51-rohs-l-6-28386633.pdf?src-supplier=Avnet+Europe; ComponentLink9URL: https://datasheet.ciiva.com/15189/getdatasheetpartid-326379-15189533.pdf?src-supplier=Verical; ComponentLink9Description: https://datasheet.ciiva.com/15189/getdatasheetpartid-326379-15189533.pdf?src-supplier=Verical
R295 R296 = Resistor: as R273 on sheet HI_Curr_ADP1850; Supplier 1: Digi-Key; Supplier Part Number 1: A129640CT-ND; RoHS: No; Stock 1: 103306; Pricing 1: 1=0,10000, 10=0,02100, 100=0,00860, 1000=0,00387, 2500=0,00336, 5000=0,00277 (USD); ComponentLink1URL: https://www.te.com/commerce/DocumentDelivery/DDEController?Action=srchrtrv&DocNm=1773204-3&DocType=DS&DocLang=English&src-supplier=Digi-Key; ComponentLink1Description: https://www.te.com/commerce/DocumentDelivery/DDEController?Action=srchrtrv&DocNm=1773204-3&DocType=DS&DocLang=English&src-supplier=Digi-Key; ComponentLink2URL: http://www.te.com/commerce/DocumentDelivery/DDEController?Action=srchrtrv&DocNm=1773204-3&DocType=DS&DocLang=English&src-supplier=Digi-Key; ComponentLink2Description: http://www.te.com/commerce/DocumentDelivery/DDEController?Action=srchrtrv&DocNm=1773204-3&DocType=DS&DocLang=English&src-supplier=Digi-Key; Resistance: 12kR
R299 = Resistor: as R275 on sheet HI_Curr_ADP1850; Supplier 1: Digi-Key; Manufacturer: Panasonic; RoHS: Yes; Category: Chip SMD Resistors; Stock 1: 1709999; Pricing 1: 1=0,10000, 10=0,04500, 100=0,01830, 1000=0,00822, 2500=0,00713, 5000=0,00589 (USD); Mount: Surface Mount; Case/Package: 0402; Number of Pins: 2; Case Code (Imperial): 0402; Case Code (Metric): 1005; Contact Plating: Tin; Min Operating Temperature: -55°C; Max Operating Temperature: 155°C; Packaging: Tape and Reel; Resistance: 47kR; Package Quantity: 1; Termination: SMD/SMT; Composition: Thick Film; Number of Terminations: 2; Military Standard: Not; Max Power Dissipation: 100mW; Voltage Rating (DC): 50V; Features: Automotive AEC-Q200; Length: 1mm; Height: 0.35mm; Width: 0.5mm; Depth: 0.5mm; Radiation Hardening: No; REACH SVHC: No SVHC; Lead Free: Lead Free; ComponentLink1URL: https://datasheet.ciiva.com/11821/0900766b80f80784-11821335.pdf?src-supplier=RSComponents; ComponentLink1Description: https://datasheet.ciiva.com/11821/0900766b80f80784-11821335.pdf?src-supplier=RSComponents; ComponentLink2URL: https://datasheet.ciiva.com/7802/426256-7802678.pdf?src-supplier=Element14; ComponentLink2Description: https://datasheet.ciiva.com/7802/426256-7802678.pdf?src-supplier=Element14; ComponentLink3URL: https://datasheet.ciiva.com/9189/aoa0000ce2-9189321.pdf?src-supplier=Avnet; ComponentLink3Description: https://datasheet.ciiva.com/9189/aoa0000ce2-9189321.pdf?src-supplier=Avnet; ComponentLink4URL: https://datasheet.ciiva.com/16514/aoa0000ce2-16514377.pdf?src-supplier=Avnet+Asia; ComponentLink4Description: https://datasheet.ciiva.com/16514/aoa0000ce2-16514377.pdf?src-supplier=Avnet+Asia; ComponentLink5URL: https://datasheet.ciiva.com/28587/1678782-28587161.pdf?src-supplier=Element14; ComponentLink5Description: https://datasheet.ciiva.com/28587/1678782-28587161.pdf?src-supplier=Element14; ComponentLink6URL: https://datasheet.ciiva.com/7802/aoa0000ce2-7802411.pdf?src-supplier=Element14; ComponentLink6Description: https://datasheet.ciiva.com/7802/aoa0000ce2-7802411.pdf?src-supplier=Element14; ComponentLink7URL: https://datasheet.ciiva.com/16769/70260748-16769387.pdf?src-supplier=Allied+Electronics; ComponentLink7Description: https://datasheet.ciiva.com/16769/70260748-16769387.pdf?src-supplier=Allied+Electronics; ComponentLink8URL: https://datasheet.ciiva.com/22668/1678782-22668316.pdf?src-supplier=Element14; ComponentLink8Description: https://datasheet.ciiva.com/22668/1678782-22668316.pdf?src-supplier=Element14; ComponentLink9URL: https://datasheet.ciiva.com/16770/70260748-16770349.pdf?src-supplier=Allied+Electronics; ComponentLink9Description: https://datasheet.ciiva.com/16770/70260748-16770349.pdf?src-supplier=Allied+Electronics; ComponentLink10URL: https://datasheet.ciiva.com/43467/1678782-43467455.pdf?src-supplier=Farnell; ComponentLink10Description: https://datasheet.ciiva.com/43467/1678782-43467455.pdf?src-supplier=Farnell; ComponentLink11URL: https://datasheet.ciiva.com/46372/1678782-46372853.pdf?src-supplier=Element14; ComponentLink11Description: https://datasheet.ciiva.com/46372/1678782-46372853.pdf?src-supplier=Element14
R619 = Resistor: Manufacturer: Stackpole Electronics; Manufacturer Part Number: RMCF0402FT1K91; Tolerance: 1%; Max Power Dissipation: 63mW; Temperature Coefficient: 100ppm/°C; Supplier 1: Digi-Key; Stock 1: 24353; Pricing 1: 1 = 0,10000, 10 = 0,01400, 100 = 0,00580, 1000 = 0,00262, 2500 = 0,00228, 5000 = 0,00188 (USD); RoHS: Yes; Mount: Surface Mount; Case/Package: 0402; Case Code (Metric): 1005; Contact Plating: Tin,Matte; Min Operating Temperature: -55°C; Max Operating Temperature: 155°C; Resistance: 1.91kR; Packaging: Tape and Reel; Composition: Thick Film; Number of Terminations: 2; Features: Automotive AEC-Q200; Length: 0.039inch; Height: 0.016inch; Width: 0.02inch; Radiation Hardening: No; Lead Free: Lead Free; ComponentLink1URL: http://components.arrow.com/part/dataview/51399400S357618N1174?src-supplier=Arrow; ComponentLink1Description: http://components.arrow.com/part/dataview/51399400S357618N1174?src-supplier=Arrow; ComponentLink2URL: https://www.seielect.com/Catalog/SEI-RMCF_RMCP.pdf?src-supplier=Digi-Key; ComponentLink2Description: https://www.seielect.com/Catalog/SEI-RMCF_RMCP.pdf?src-supplier=Digi-Key; ComponentLink3URL: https://www.seielect.com/catalog/SEI-RMCF_RMCP.pdf?src-supplier=Avnet; ComponentLink3Description: https://www.seielect.com/catalog/SEI-RMCF_RMCP.pdf?src-supplier=Avnet; ComponentLink4URL: https://www.seielect.com/catalog/SEI-Packaging.pdf?src-supplier=Digi-Key; ComponentLink4Description: https://www.seielect.com/catalog/SEI-Packaging.pdf?src-supplier=Digi-Key
R620 = Resistor: Manufacturer: Yageo; Manufacturer Part Number: RC0402FR-072KL; Tolerance: 1%; Power Rating: 63mW; Voltage Rating: 50V; Temperature Coefficient: 100ppm/°C; Supplier 1: Digi-Key; Stock 1: 9276818; Pricing 1: 1 = 0,10000, 10 = 0,01600, 100 = 0,00640, 1000 = 0,00289, 2500 = 0,00251, 5000 = 0,00207 (USD); RoHS: Yes; Case/Package: 0402; Case Code (Metric): 1005; Min Operating Temperature: -55°C; Max Operating Temperature: 155°C; Package Quantity: 1; Resistance: 2kR; Packaging: Tape and Reel; Composition: Thick Film; Number of Terminations: 2; Termination: SMD/SMT; Military Standard: Not; Max Power Dissipation: 63mW; Voltage Rating (DC): 50V; Working Voltage: 50V; Features: Moisture Resistant; Length: 1mm; Height: 0.016inch; Width: 0.02inch; Depth: 0.5mm; REACH SVHC: Unknown; Lead Free: Lead Free; ComponentLink1URL: https://datasheet.ciiva.com/11808/0900766b80c66297-11808787.pdf?src-supplier=RSComponents; ComponentLink1Description: https://datasheet.ciiva.com/11808/0900766b80c66297-11808787.pdf?src-supplier=RSComponents; ComponentLink2URL: https://datasheet.ciiva.com/2453/pyu-r-int-thick-7-2453634.pdf?src-supplier=Digi-Key; ComponentLink2Description: https://datasheet.ciiva.com/2453/pyu-r-int-thick-7-2453634.pdf?src-supplier=Digi-Key; ComponentLink3URL: https://datasheet.ciiva.com/2453/pyu-r-int-thick-7-2453635.pdf?src-supplier=Digi-Key; ComponentLink3Description: https://datasheet.ciiva.com/2453/pyu-r-int-thick-7-2453635.pdf?src-supplier=Digi-Key; ComponentLink4URL: https://datasheet.ciiva.com/2453/pyu-r-int-thick-7-2453636.pdf?src-supplier=Digi-Key; ComponentLink4Description: https://datasheet.ciiva.com/2453/pyu-r-int-thick-7-2453636.pdf?src-supplier=Digi-Key; ComponentLink5URL: https://datasheet.ciiva.com/15189/getdatasheetpartid-358921-15189414.pdf?src-supplier=Verical; ComponentLink5Description: https://datasheet.ciiva.com/15189/getdatasheetpartid-358921-15189414.pdf?src-supplier=Verical; ComponentLink6URL: https://datasheet.ciiva.com/12667/pyu-rc0402-51-rohs-l-6-r-12667451.pdf?src-supplier=Mouser; ComponentLink6Description: https://datasheet.ciiva.com/12667/pyu-rc0402-51-rohs-l-6-r-12667451.pdf?src-supplier=Mouser; ComponentLink7URL: https://datasheet.ciiva.com/7983/1018594-7983517.pdf?src-supplier=Element14; ComponentLink7Description: https://datasheet.ciiva.com/7983/1018594-7983517.pdf?src-supplier=Element14; ComponentLink8URL: https://datasheet.ciiva.com/7849/1018594-7849934.pdf?src-supplier=Element14; ComponentLink8Description: https://datasheet.ciiva.com/7849/1018594-7849934.pdf?src-supplier=Element14; ComponentLink9URL: https://datasheet.ciiva.com/7849/1018594-7849935.pdf?src-supplier=Element14; ComponentLink9Description: https://datasheet.ciiva.com/7849/1018594-7849935.pdf?src-supplier=Element14
R621 = Resistor: Res Thick Film 0402 147K Ohm 1% 1/16W 100ppm/C Molded SMD SMD Paper T/R; Manufacturer: Stackpole Electronics; Manufacturer Part Number: RMCF0402FT147K; Max Power Dissipation: 63mW; Temperature Coefficient: 100ppm/°C; Supplier 1: Digi-Key; Stock 1: 24917; Pricing 1: 1 = 0,10000, 10 = 0,01400, 100 = 0,00580, 1000 = 0,00262, 2500 = 0,00228, 5000 = 0,00188 (USD); RoHS: Yes; Mount: Surface Mount; Case/Package: 0402; Case Code (Metric): 1005; Contact Plating: Tin,Matte; Min Operating Temperature: -55°C; Max Operating Temperature: 155°C; Resistance: 147kR; Tolerance: 1%; Packaging: Tape and Reel; Composition: Thick Film; Number of Terminations: 2; Military Standard: Not; Features: Automotive AEC-Q200; Length: 0.039inch; Height: 0.016inch; Width: 0.02inch; Depth: 0.5mm; Radiation Hardening: No; Lead Free: Lead Free; ComponentLink1URL: https://www.seielect.com/Catalog/SEI-RMCF_RMCP.pdf?src-supplier=Digi-Key; ComponentLink1Description: https://www.seielect.com/Catalog/SEI-RMCF_RMCP.pdf?src-supplier=Digi-Key; ComponentLink2URL: https://www.seielect.com/catalog/SEI-Packaging.pdf?src-supplier=Digi-Key; ComponentLink2Description: https://www.seielect.com/catalog/SEI-Packaging.pdf?src-supplier=Digi-Key; ComponentLink3URL: https://www.seielect.com/catalog/SEI-RMCF_RMCP.pdf?src-supplier=Avnet; ComponentLink3Description: https://www.seielect.com/catalog/SEI-RMCF_RMCP.pdf?src-supplier=Avnet; Supplier 2: Digi-Key; Category: Chip SMD Resistors; Stock 2: 28345; Pricing 2: 1=0,10000, 10=0,01400, 100=0,00580, 1000=0,00262, 2500=0,00228, 5000=0,00188 (USD)
R622 = Resistor: Manufacturer: Stackpole Electronics; Manufacturer Part Number: RMCF0402FT340K; Tolerance: 1%; Max Power Dissipation: 63mW; Temperature Coefficient: 100ppm/°C; Supplier 1: Digi-Key; Supplier Part Number 1: RMCF0402FT340KCT-ND; Stock 1: 52105; Pricing 1: 1 = 0,10000, 10 = 0,01400, 100 = 0,00580, 1000 = 0,00262, 2500 = 0,00228, 5000 = 0,00188 (USD); RoHS: Yes; Mount: Surface Mount; Case/Package: 0402; Case Code (Metric): 1005; Contact Plating: Tin,Matte; Min Operating Temperature: -55°C; Max Operating Temperature: 155°C; Packaging: Tape and Reel; Resistance: 340kR; Composition: Thick Film; Number of Terminations: 2; Military Standard: Not; Features: Automotive AEC-Q200; Length: 0.039inch; Height: 0.016inch; Width: 0.02inch; Depth: 0.5mm; Radiation Hardening: No; ComponentLink1URL: https://www.verical.com/server-webapp/html/getDatasheet?partID=689254&src-supplier=Verical; ComponentLink1Description: https://www.verical.com/server-webapp/html/getDatasheet?partID=689254&src-supplier=Verical; ComponentLink2URL: http://components.arrow.com/part/dataview/47811509S8404077N1174?src-supplier=Arrow; ComponentLink2Description: http://components.arrow.com/part/dataview/47811509S8404077N1174?src-supplier=Arrow; ComponentLink3URL: https://www.seielect.com/catalog/SEI-RMCF_RMCP.pdf?src-supplier=Avnet; ComponentLink3Description: https://www.seielect.com/catalog/SEI-RMCF_RMCP.pdf?src-supplier=Avnet; ComponentLink4URL: https://www.seielect.com/Catalog/SEI-RMCF_RMCP.pdf?src-supplier=Digi-Key; ComponentLink4Description: https://www.seielect.com/Catalog/SEI-RMCF_RMCP.pdf?src-supplier=Digi-Key; ComponentLink5URL: https://www.seielect.com/catalog/SEI-Packaging.pdf?src-supplier=Digi-Key; ComponentLink5Description: https://www.seielect.com/catalog/SEI-Packaging.pdf?src-supplier=Digi-Key
R623 = Resistor: Manufacturer: Panasonic; Manufacturer Part Number: ERA-2AEB1431X; Power Rating: 62.5mW; Tolerance: 0.1%; Temperature Coefficient: 25ppm/°C; Voltage Rating: 50V; Max Power Dissipation: 63mW; Supplier 1: Digi-Key; Supplier Part Number 1: P1.43KDCCT-ND; Stock 1: 20142; Pricing 1: 1 = 0,45000, 10 = 0,32100, 100 = 0,12830, 1000 = 0,06322, 2500 = 0,05858, 5000 = 0,05300 (USD); RoHS: Yes; Mount: Surface Mount; Case/Package: 0402; Weight: 2.8E-05oz; Case Code (Metric): 1005; Min Operating Temperature: -55°C; Max Operating Temperature: 155°C; Package Quantity: 1; Resistance: 1.43kR; Packaging: Tape and Reel; Composition: Thin Film; Number of Terminations: 2; Termination: SMD/SMT; Voltage Rating (DC): 50V; Features: Automotive AEC-Q200; Length: 0.039inch; Height: 0.016inch; Width: 0.02inch; REACH SVHC: Unknown; Lead Free: Lead Free; ComponentLink1URL: http://www.mouser.com/ds/2/315/AOA0000C237-1100991.pdf?src-supplier=Mouser; ComponentLink1Description: http://www.mouser.com/ds/2/315/AOA0000C237-1100991.pdf?src-supplier=Mouser; ComponentLink2URL: https://industrial.panasonic.com/cdbs/www-data/pdf/RDM0000/AOA0000C307.pdf?src-supplier=Digi-Key; ComponentLink2Description: https://industrial.panasonic.com/cdbs/www-data/pdf/RDM0000/AOA0000C307.pdf?src-supplier=Digi-Key; ComponentLink3URL: http://www.farnell.com/datasheets/2052875.pdf?src-supplier=Newark; ComponentLink3Description: http://www.farnell.com/datasheets/2052875.pdf?src-supplier=Newark; ComponentLink4URL: http://industrial.panasonic.com/www-data/pdf/AOA0000/AOA0000CE26.pdf?src-supplier=Avnet; ComponentLink4Description: http://industrial.panasonic.com/www-data/pdf/AOA0000/AOA0000CE26.pdf?src-supplier=Avnet; ComponentLink5URL: http://www.onlinecomponents.com/datasheet/era-2aeb1431x.aspx?p=44473575&src-supplier=Onlinecomponents.com; ComponentLink5Description: http://www.onlinecomponents.com/datasheet/era-2aeb1431x.aspx?p=44473575&src-supplier=Onlinecomponents.com; ComponentLink6URL: http://www.farnell.com/datasheets/1818319.pdf?src-supplier=Element14; ComponentLink6Description: http://www.farnell.com/datasheets/1818319.pdf?src-supplier=Element14